# Altium schematic sheet Sheet10.SchDoc
size A; SheetNumber: 10; SheetTotal: 10
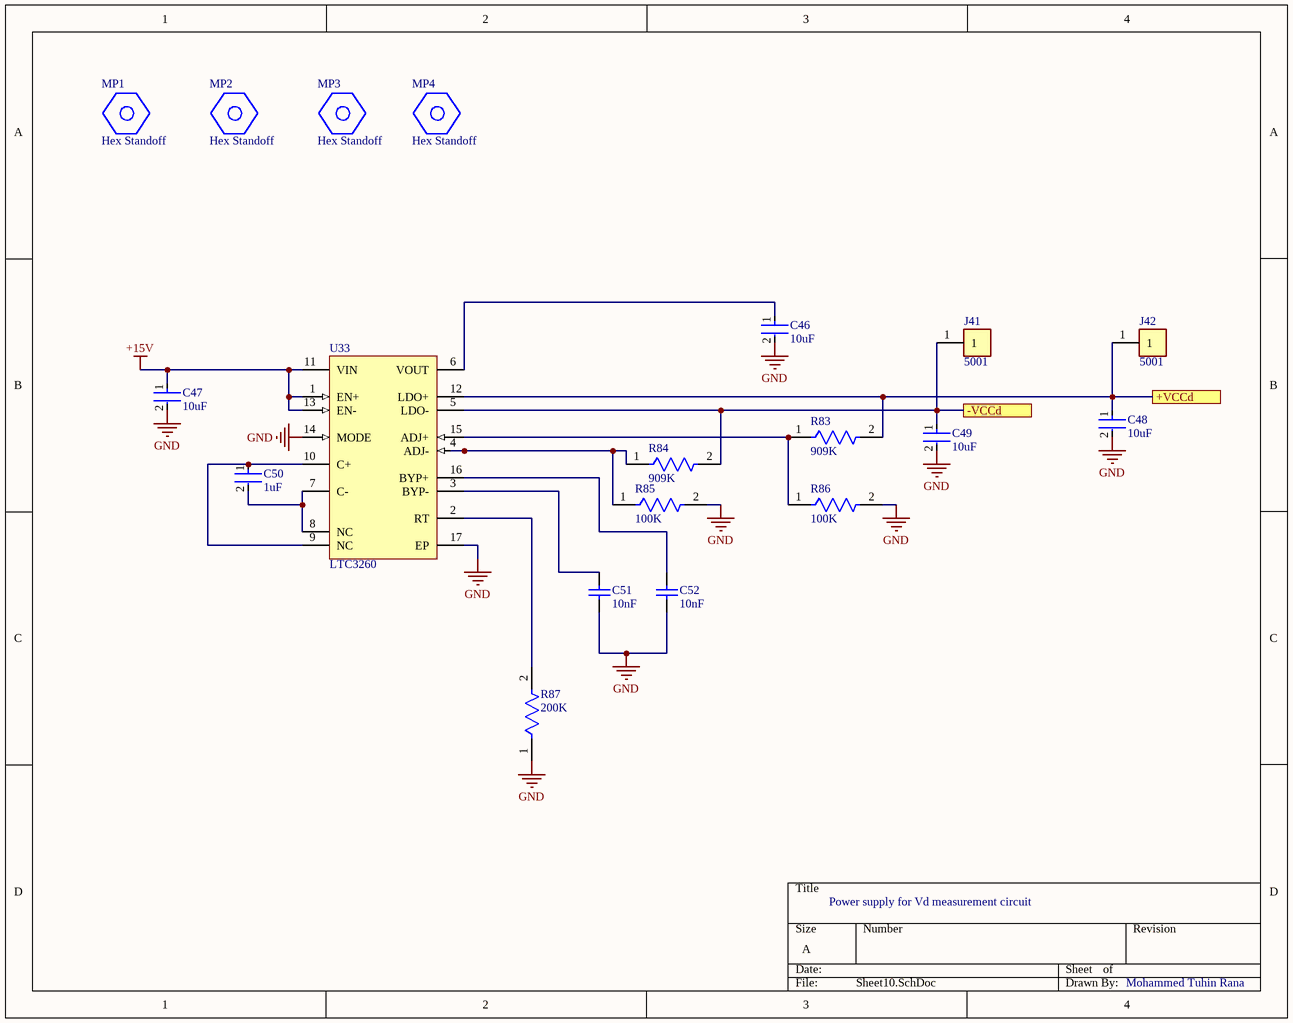
[diagram p0: Sheet10.SchDoc]

## Parts
C46  10uF  [FP-C1210C106M6PACTU-MFG]
C47  10uF  [FP-C1210C106M6PACTU-MFG]
C48  10uF  [FP-C1210C106M6PACTU-MFG]
C49  10uF  [FP-C1210C106M6PACTU-MFG]
C50  1uF  [FP-GRM55D-0_4-IPC_A]
C51  10nF  [CAPC2013X100X50NL20T25]
C52  10nF  [CAPC2013X100X50NL20T25]
J41  5001  [FP-5001-MFG]
J42  5001  [FP-5001-MFG]
MP1  Hex Standoff  [FP-2056-440-AL-MFG]
MP2  Hex Standoff  [FP-2056-440-AL-MFG]
MP3  Hex Standoff  [FP-2056-440-AL-MFG]
MP4  Hex Standoff  [FP-2056-440-AL-MFG]
R83  909K  [FP-CRCW1206-e3-IPC_C]
R84  909K  [FP-CRCW1206-e3-IPC_C]
R85  100K  [FP-AC1206-MFG]
R86  100K  [FP-AC1206-MFG]
R87  200K  [FP-CRCW1206-e3-MFG]
U33  LTC3260  [LT-MSE-16-EDP_L]

## Ports
+VCCd (see Sheet5[1A], Sheet5[1C], Sheet5[2A], Sheet5[2B], Sheet5[3B], Sheet5[3C], Sheet5[4B]), -VCCd (see Sheet5[1B], Sheet5[1D], Sheet5[2B], Sheet5[2C], Sheet5[3C], Sheet5[3D], Sheet5[4C])

## Nets
+15V: C47.1 U33.1(EN+) U33.11(VIN) U33.13(EN-)
GND: C46.2 C47.2 C48.2 C49.2 C51.1 C52.1 R85.2 R86.2 R87.1 U33.14(MODE) U33.17(EP)
+VCCd: C48.1 J42.1 R83.2 U33.12(LDO+) ; port +VCCd
-VCCd: C49.1 J41.1 R84.2 U33.5(LDO-) ; port -VCCd
NetC46_1: C46.1 U33.6(VOUT)
NetC50_1: C50.1 U33.9(NC) U33.10(C+)
NetC50_2: C50.2 U33.7(C-) U33.8(NC)
NetC51_2: C51.2 U33.3(BYP-)
NetC52_2: C52.2 U33.16(BYP+)
NetR83_1: R83.1 R86.1 U33.15(ADJ+)
NetR84_1: R84.1 R85.1 U33.4(ADJ-)
NetR87_2: R87.2 U33.2(RT)

## Notes on the sheet
- Power supply for Vd measurement circuit
- Mohammed Tuhin Rana

## Library data of the parts
C46-C49 = CMP-1038-02235-2: CAP CER 10UF 35V X5R 1210; Dissipation Factor: 2.5%; Tolerance: 20%; Dielectric Material: Ceramic; Voltage: 35V; Package Quantity: 2000; Series: C; Case Code (Metric): 3225; Length: 3.2mm; Dielectric: X5R; Height: 1.9mm; Max Operating Temperature: 85°C; Termination: SMD/SMT; Case/Package: 1210; Min Operating Temperature: -55°C; Depth: 2.5mm; Packaging: Tape and Reel; Case Code (Imperial): 1210; Width: 2.5mm; Radiation Hardening: No; Voltage Rating: 35V; Mount: Surface Mount; Voltage Rating (DC): 35V; Capacitance: 10uF; Thickness: 0.083inch; Construction: Flat; REACH SVHC: No SVHC
C50 = CMP-2000-06370-2: Chip Multilayer Ceramic Capacitors for General Purpose, 2220, 1.0uF, X7R, 15%, 10%, 250V; Width: 5mm; Capacitance: 1uF; Height: 2mm; Case Code (Imperial): 2220; Voltage Rating (DC): 250V; Max Operating Temperature: 125°C; Number of Pins: 2; Min Operating Temperature: -55°C; Termination: SMD/SMT; Case/Package: 2220; Dielectric: X7R; Material: Ceramic; REACH SVHC: No SVHC; Voltage: 250V; Packaging: Tape and Reel; Thickness: 0.087inch; Depth: 5mm; Package Quantity: 1; Tolerance: 10%; Mount: Surface Mount; Voltage Rating: 250V; Length: 5.7mm; Case Code (Metric): 5750; Lead Free: Lead Free
C51 C52 = CMP-2007-03708-1: Part Number: C0805F103K5RACTU; Manufacturer: Kemet
J41 J42 = CMP-2000-05181-2: PC TEST POINT MINIATURE BLACK; Body Material: Bronze; Plating: Silver; Inside Diameter: 1.27mm; Hole Diameter: 1.6mm; Number of Ports: 1; Outside Diameter: 2.54mm; Insulation: Insulated; Insulation Material: Nylon; Mount: Through Hole; RoHS Compliant: Yes; Series: THM; Height: 0.3inch; Termination: Through Hole; Material: Nylon; Packaging: Bulk; Contact Material: Bronze; REACH SVHC: No SVHC; Contact Plating: Silver; Orientation: Straight; Lead Free: Lead Free; Package Quantity: 100; Length: 7.62mm; Flammability Rating: UL94 V-0; Number of Contacts: 1; Diameter: 2.54mm; Housing Color: Black; Color: Black
MP1-MP4 = CMP-46196-000003-1: HEX STANDOFF #4-40 ALUM 7/16"; Threaded/Unthreaded: Threaded; Body Length: 0.437inch; Gender: Female, Female; Thread Size: #4-40; Size: 0.187inch; Case/Package: Aluminum; Series: -; Material: Aluminium
R83 R84 = CMP-2003-02425-2: RES Thick Film, 909kΩ, 1%, 0.25W, 100ppm/°C, 1206; Resistance: 909kR; Power Rating: 250mW; Voltage Rating: 200V; Contact Plating: Tin; Number of Terminations: 2; Package Quantity: 10; Case Code (Imperial): 1206; Features: Automotive AEC-Q200; Termination: SMD/SMT; Lead Free: Lead Free; Depth: 1.6mm; Min Operating Temperature: -55°C; Case/Package: 1206; Width: 1.6mm; Tolerance: 1%; Military Standard: Not; Voltage Rating (DC): 200V; Composition: Thick Film; Radiation Hardening: No; Max Power Dissipation: 250mW; Packaging: Tape and Reel; Case Code (Metric): 3216; Height: 0.024inch; Temperature Coefficient: 100ppm/°C; Max Operating Temperature: 155°C; Length: 3.2mm; Weight: 0.000353oz
R85 R86 = CMP-2003-04909-2: RES SMD 100K OHM 1% 1/4W 1206; Manufacturer: Yageo; Manufacturer Part Number: AC1206FR-07100KL; Resistance: 100KΩ; Power Rating: 0.25W; Value: 100KΩ; Voltage Rating: 200V; Automotive Grade: Grade 0; Tolerance: 0.01; Mouser Description: RES SMD 100K OHM 1% 1/4W 1206; Ipc Land Pattern Name: RESC310160X55; Temperature Range Low: -55°C; Package: AC1206; Temperature: -55°C to +155°C; Device Class L3: Chip SMD Resistors; Lead Free: Yes; Temperature Range High: +155°C; Series: AC; Octopart: https://octopart.com/ac1206fr-07100kl-yageo-21711116; Height: 0.65mm; Footprint Url: http://www.yageo.com/exep/pages/download/literatures/PYu-R_Mount_10.pdf; RoHS: TRUE; Category: Res; Automotive: Yes; Composition: Thick Film; Device Class L2: Resistors; ComponentLink2URL: http://www.yageo.com/NewPortal/yageodocoutput?fileName=/pdf/R-Chip/PYu-AC_51_RoHS_L_6.pdf; Digikey Description: RES SMD 100K OHM 1% 1/4W 1206; ComponentLink2Description: Datasheet; Device Class L1: Passive Components
R87 = CMP-2003-01933-2: RES Thick Film, 200kΩ, 1%, 0.25W, 100ppm/°C, 1206; Power Rating: 250mW; Resistance: 200kR; Working Voltage: 200V; Case Code (Metric): 3216; Tolerance: 1%; Mount: Surface Mount; Packaging: Tape and Reel; Case Code (Imperial): 1206; Depth: 1.6mm; Military Standard: Not; Max Operating Temperature: 155°C; Length: 3.2mm; Radiation Hardening: No; Number of Terminations: 2; Features: Automotive AEC-Q200; Width: 1.6mm; Lead Free: Lead Free; Composition: Thick Film; Package Quantity: 10; Min Operating Temperature: -55°C; Contact Plating: Tin; Voltage Rating (DC): 200V; Temperature Coefficient: 100ppm/°C; Height: 0.55mm; Weight: 0.000353oz; Case/Package: 1206; Voltage Rating: 200V; Termination: SMD/SMT; Max Power Dissipation: 250mW
U33 = CMP-0475-00260-1: Low Noise Dual Supply Inverting Charge Pump, 4.5 to 32 V Vin, Adjustable Vout, 16-pin SOP (MSE-16-EDP), -40 to 125 degC, Pb-Free, Tape and Reel; PartNumber: LTC3260EMSE#TRPBF; Manufacturer: Linear Technology; Max Iout(mA): 100; Isupply(mA): 0.1; Ishutdown(uA): 2; Vin Min(V): 4.5; Frequency(kHz): 500; Vin Max(V): 32; Voutput: Adj; ComponentLink2URL: http://cds.linear.com/docs/en/datasheet/3260fa.pdf; PackageReference: MSE-16; Mounting Technology: Surface Mount; DatasheetVersion: Rev. A; ComponentLink3URL: http://cds.linear.com/docs/en/packaging/05081667_F_MSE16.pdf; ComponentLink1Description: Manufacturer URL; ComponentLink1URL: http://www.linear.com/; Packing: Tape and Reel; RoHS: TRUE; PackageDescription: 16-Pin Plastic MSOP, Exposed Die Pad, Body 4.039 x 3 mm, Pitch 0.5 mm; ComponentLink3Description: Package Specification; ComponentLink2Description: Datasheet; PackageVersion: Rev. F, 05/2013